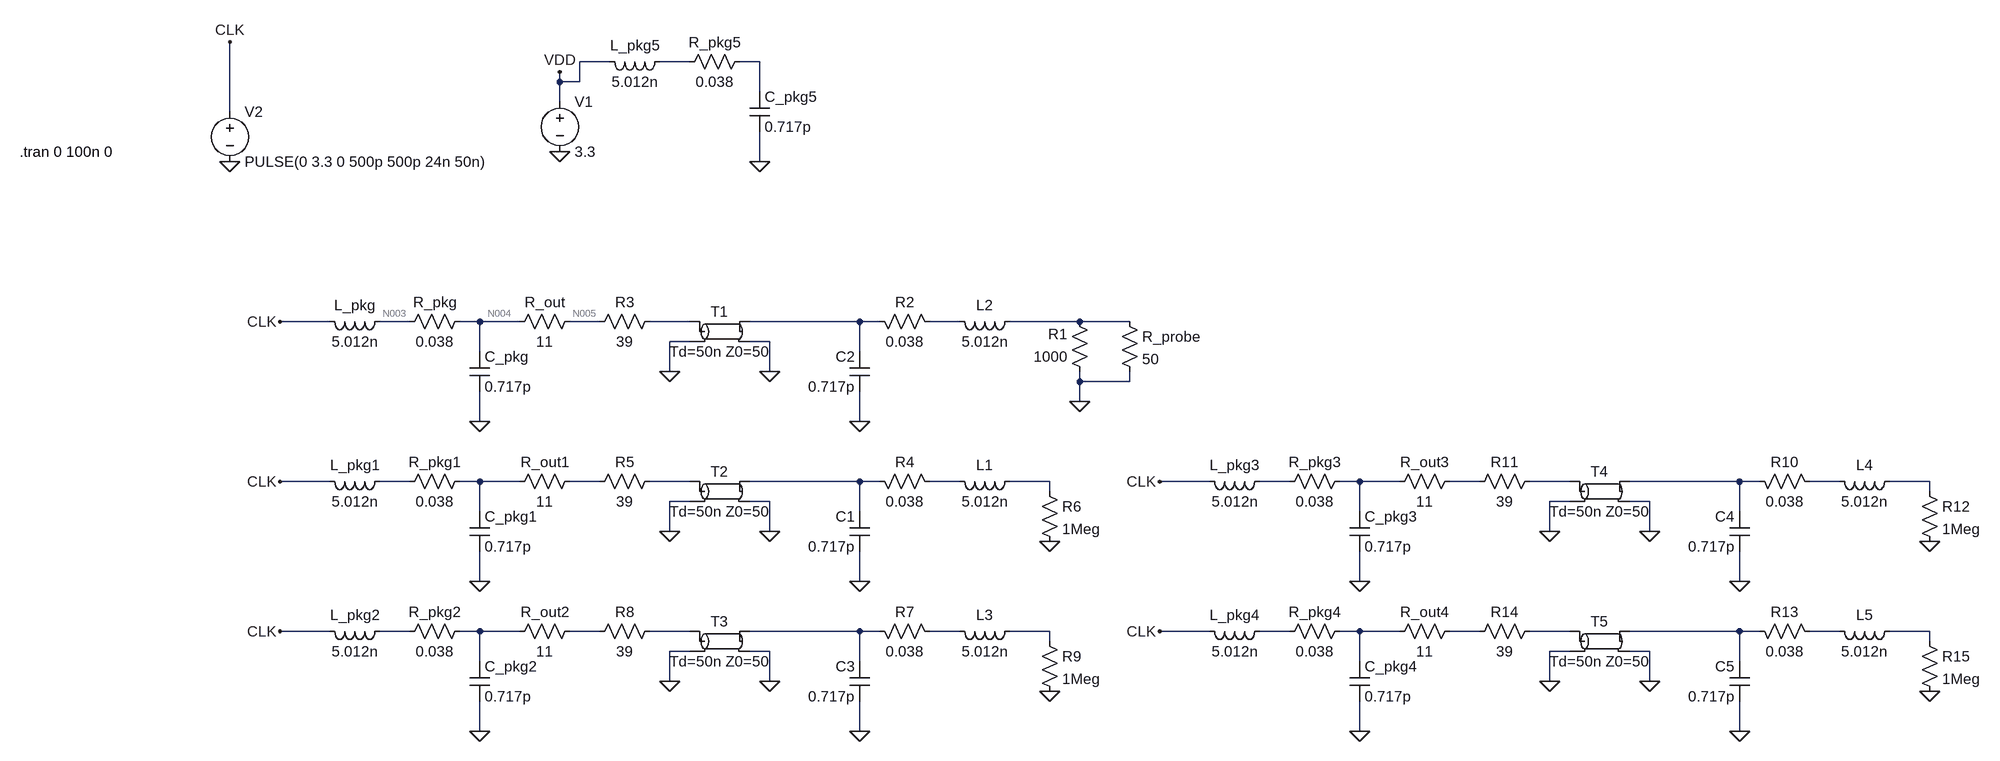
[diagram p0: schematic Assignment2_SOIC.asc]
Assignment2_SOIC.asc, the LTspice schematic file:
Version 4.1
SHEET 1 2280 948
WIRE 80 -144 32 -144
WIRE 208 -144 160 -144
WIRE 320 -144 288 -144
WIRE 0 -112 0 -128
WIRE 32 -112 32 -144
WIRE 32 -112 0 -112
WIRE 320 -96 320 -144
WIRE 0 -80 0 -112
WIRE -528 -64 -528 -176
WIRE 320 16 320 -32
WIRE -368 272 -448 272
WIRE -240 272 -288 272
WIRE -128 272 -160 272
WIRE -64 272 -128 272
WIRE 64 272 16 272
WIRE 208 272 144 272
WIRE 480 272 304 272
WIRE 512 272 480 272
WIRE 640 272 592 272
WIRE 832 272 720 272
WIRE 912 272 832 272
WIRE 208 304 176 304
WIRE 336 304 304 304
WIRE -128 320 -128 272
WIRE 480 320 480 272
WIRE 176 352 176 304
WIRE 336 352 336 304
WIRE 832 368 832 352
WIRE 912 368 912 352
WIRE 912 368 832 368
WIRE 832 400 832 368
WIRE -128 432 -128 384
WIRE 480 432 480 384
WIRE -368 528 -448 528
WIRE -240 528 -288 528
WIRE -128 528 -160 528
WIRE -64 528 -128 528
WIRE 64 528 16 528
WIRE 208 528 144 528
WIRE 480 528 304 528
WIRE 512 528 480 528
WIRE 640 528 592 528
WIRE 784 528 720 528
WIRE 1040 528 960 528
WIRE 1168 528 1120 528
WIRE 1280 528 1248 528
WIRE 1344 528 1280 528
WIRE 1472 528 1424 528
WIRE 1616 528 1552 528
WIRE 1888 528 1712 528
WIRE 1920 528 1888 528
WIRE 2048 528 2000 528
WIRE 2192 528 2128 528
WIRE 784 544 784 528
WIRE 2192 544 2192 528
WIRE 208 560 176 560
WIRE 336 560 304 560
WIRE 1616 560 1584 560
WIRE 1744 560 1712 560
WIRE -128 576 -128 528
WIRE 480 576 480 528
WIRE 1280 576 1280 528
WIRE 1888 576 1888 528
WIRE 176 608 176 560
WIRE 336 608 336 560
WIRE 1584 608 1584 560
WIRE 1744 608 1744 560
WIRE -128 688 -128 640
WIRE 480 688 480 640
WIRE 1280 688 1280 640
WIRE 1888 688 1888 640
WIRE -368 768 -448 768
WIRE -240 768 -288 768
WIRE -128 768 -160 768
WIRE -64 768 -128 768
WIRE 64 768 16 768
WIRE 208 768 144 768
WIRE 480 768 304 768
WIRE 512 768 480 768
WIRE 640 768 592 768
WIRE 784 768 720 768
WIRE 1040 768 960 768
WIRE 1168 768 1120 768
WIRE 1280 768 1248 768
WIRE 1344 768 1280 768
WIRE 1472 768 1424 768
WIRE 1616 768 1552 768
WIRE 1888 768 1712 768
WIRE 1920 768 1888 768
WIRE 2048 768 2000 768
WIRE 2192 768 2128 768
WIRE 784 784 784 768
WIRE 2192 784 2192 768
WIRE 208 800 176 800
WIRE 336 800 304 800
WIRE 1616 800 1584 800
WIRE 1744 800 1712 800
WIRE -128 816 -128 768
WIRE 480 816 480 768
WIRE 1280 816 1280 768
WIRE 1888 816 1888 768
WIRE 176 848 176 800
WIRE 336 848 336 800
WIRE 1584 848 1584 800
WIRE 1744 848 1744 800
WIRE -128 928 -128 880
WIRE 480 928 480 880
WIRE 1280 928 1280 880
WIRE 1888 928 1888 880
FLAG -528 16 0
FLAG 0 0 0
FLAG 0 -128 VDD
FLAG -528 -176 CLK
FLAG -128 432 0
FLAG 480 432 0
FLAG 176 352 0
FLAG 336 352 0
FLAG -448 272 CLK
FLAG 832 400 0
FLAG -128 688 0
FLAG 480 688 0
FLAG 176 608 0
FLAG 336 608 0
FLAG -448 528 CLK
FLAG 784 624 0
FLAG -128 928 0
FLAG 480 928 0
FLAG 176 848 0
FLAG 336 848 0
FLAG -448 768 CLK
FLAG 784 864 0
FLAG 1280 688 0
FLAG 1888 688 0
FLAG 1584 608 0
FLAG 1744 608 0
FLAG 960 528 CLK
FLAG 2192 624 0
FLAG 1280 928 0
FLAG 1888 928 0
FLAG 1584 848 0
FLAG 1744 848 0
FLAG 960 768 CLK
FLAG 2192 864 0
FLAG 320 16 0
SYMBOL voltage 0 -96 R0
WINDOW 123 0 0 Left 0
WINDOW 39 0 0 Left 0
SYMATTR InstName V1
SYMATTR Value 3.3
SYMBOL voltage -528 -80 R0
WINDOW 123 0 0 Left 0
WINDOW 39 0 0 Left 0
SYMATTR InstName V2
SYMATTR Value PULSE(0 3.3 0 500p 500p 24n 50n)
SYMBOL ind -272 256 R90
WINDOW 0 5 56 VBottom 2
WINDOW 3 32 56 VTop 2
SYMATTR InstName L_pkg
SYMATTR Value 5.012n
SYMATTR SpiceLine Rser=1m
SYMBOL res -144 256 R90
WINDOW 0 0 56 VBottom 2
WINDOW 3 32 56 VTop 2
SYMATTR InstName R_pkg
SYMATTR Value 0.038
SYMBOL cap -144 320 R0
SYMATTR InstName C_pkg
SYMATTR Value 0.717p
SYMBOL ind 624 256 M90
WINDOW 0 5 56 VBottom 2
WINDOW 3 32 56 VTop 2
SYMATTR InstName L2
SYMATTR Value 5.012n
SYMATTR SpiceLine Rser=1m
SYMBOL res 496 256 M90
WINDOW 0 0 56 VBottom 2
WINDOW 3 32 56 VTop 2
SYMATTR InstName R2
SYMATTR Value 0.038
SYMBOL cap 496 320 M0
SYMATTR InstName C2
SYMATTR Value 0.717p
SYMBOL res 160 256 R90
WINDOW 0 0 56 VBottom 2
WINDOW 3 32 56 VTop 2
SYMATTR InstName R3
SYMATTR Value 39
SYMBOL res 32 256 R90
WINDOW 0 0 56 VBottom 2
WINDOW 3 32 56 VTop 2
SYMATTR InstName R_out
SYMATTR Value 11
SYMBOL tline 256 288 R0
SYMATTR InstName T1
SYMBOL res 848 368 R180
WINDOW 0 36 76 Left 2
WINDOW 3 36 40 Left 2
SYMATTR InstName R1
SYMATTR Value 1000
SYMBOL res 896 256 R0
SYMATTR InstName R_probe
SYMATTR Value 50
SYMBOL ind -272 512 R90
WINDOW 0 5 56 VBottom 2
WINDOW 3 32 56 VTop 2
SYMATTR InstName L_pkg1
SYMATTR Value 5.012n
SYMATTR SpiceLine Rser=1m
SYMBOL res -144 512 R90
WINDOW 0 0 56 VBottom 2
WINDOW 3 32 56 VTop 2
SYMATTR InstName R_pkg1
SYMATTR Value 0.038
SYMBOL cap -144 576 R0
SYMATTR InstName C_pkg1
SYMATTR Value 0.717p
SYMBOL ind 624 512 M90
WINDOW 0 5 56 VBottom 2
WINDOW 3 32 56 VTop 2
SYMATTR InstName L1
SYMATTR Value 5.012n
SYMATTR SpiceLine Rser=1m
SYMBOL res 496 512 M90
WINDOW 0 0 56 VBottom 2
WINDOW 3 32 56 VTop 2
SYMATTR InstName R4
SYMATTR Value 0.038
SYMBOL cap 496 576 M0
SYMATTR InstName C1
SYMATTR Value 0.717p
SYMBOL res 160 512 R90
WINDOW 0 0 56 VBottom 2
WINDOW 3 32 56 VTop 2
SYMATTR InstName R5
SYMATTR Value 39
SYMBOL res 32 512 R90
WINDOW 0 0 56 VBottom 2
WINDOW 3 32 56 VTop 2
SYMATTR InstName R_out1
SYMATTR Value 11
SYMBOL tline 256 544 R0
SYMATTR InstName T2
SYMBOL res 768 528 R0
SYMATTR InstName R6
SYMATTR Value 1Meg
SYMBOL ind -272 752 R90
WINDOW 0 5 56 VBottom 2
WINDOW 3 32 56 VTop 2
SYMATTR InstName L_pkg2
SYMATTR Value 5.012n
SYMATTR SpiceLine Rser=1m
SYMBOL res -144 752 R90
WINDOW 0 0 56 VBottom 2
WINDOW 3 32 56 VTop 2
SYMATTR InstName R_pkg2
SYMATTR Value 0.038
SYMBOL cap -144 816 R0
SYMATTR InstName C_pkg2
SYMATTR Value 0.717p
SYMBOL ind 624 752 M90
WINDOW 0 5 56 VBottom 2
WINDOW 3 32 56 VTop 2
SYMATTR InstName L3
SYMATTR Value 5.012n
SYMATTR SpiceLine Rser=1m
SYMBOL res 496 752 M90
WINDOW 0 0 56 VBottom 2
WINDOW 3 32 56 VTop 2
SYMATTR InstName R7
SYMATTR Value 0.038
SYMBOL cap 496 816 M0
SYMATTR InstName C3
SYMATTR Value 0.717p
SYMBOL res 160 752 R90
WINDOW 0 0 56 VBottom 2
WINDOW 3 32 56 VTop 2
SYMATTR InstName R8
SYMATTR Value 39
SYMBOL res 32 752 R90
WINDOW 0 0 56 VBottom 2
WINDOW 3 32 56 VTop 2
SYMATTR InstName R_out2
SYMATTR Value 11
SYMBOL tline 256 784 R0
SYMATTR InstName T3
SYMBOL res 768 768 R0
SYMATTR InstName R9
SYMATTR Value 1Meg
SYMBOL ind 1136 512 R90
WINDOW 0 5 56 VBottom 2
WINDOW 3 32 56 VTop 2
SYMATTR InstName L_pkg3
SYMATTR Value 5.012n
SYMATTR SpiceLine Rser=1m
SYMBOL res 1264 512 R90
WINDOW 0 0 56 VBottom 2
WINDOW 3 32 56 VTop 2
SYMATTR InstName R_pkg3
SYMATTR Value 0.038
SYMBOL cap 1264 576 R0
SYMATTR InstName C_pkg3
SYMATTR Value 0.717p
SYMBOL ind 2032 512 M90
WINDOW 0 5 56 VBottom 2
WINDOW 3 32 56 VTop 2
SYMATTR InstName L4
SYMATTR Value 5.012n
SYMATTR SpiceLine Rser=1m
SYMBOL res 1904 512 M90
WINDOW 0 0 56 VBottom 2
WINDOW 3 32 56 VTop 2
SYMATTR InstName R10
SYMATTR Value 0.038
SYMBOL cap 1904 576 M0
SYMATTR InstName C4
SYMATTR Value 0.717p
SYMBOL res 1568 512 R90
WINDOW 0 0 56 VBottom 2
WINDOW 3 32 56 VTop 2
SYMATTR InstName R11
SYMATTR Value 39
SYMBOL res 1440 512 R90
WINDOW 0 0 56 VBottom 2
WINDOW 3 32 56 VTop 2
SYMATTR InstName R_out3
SYMATTR Value 11
SYMBOL tline 1664 544 R0
SYMATTR InstName T4
SYMBOL res 2176 528 R0
SYMATTR InstName R12
SYMATTR Value 1Meg
SYMBOL ind 1136 752 R90
WINDOW 0 5 56 VBottom 2
WINDOW 3 32 56 VTop 2
SYMATTR InstName L_pkg4
SYMATTR Value 5.012n
SYMATTR SpiceLine Rser=1m
SYMBOL res 1264 752 R90
WINDOW 0 0 56 VBottom 2
WINDOW 3 32 56 VTop 2
SYMATTR InstName R_pkg4
SYMATTR Value 0.038
SYMBOL cap 1264 816 R0
SYMATTR InstName C_pkg4
SYMATTR Value 0.717p
SYMBOL ind 2032 752 M90
WINDOW 0 5 56 VBottom 2
WINDOW 3 32 56 VTop 2
SYMATTR InstName L5
SYMATTR Value 5.012n
SYMATTR SpiceLine Rser=1m
SYMBOL res 1904 752 M90
WINDOW 0 0 56 VBottom 2
WINDOW 3 32 56 VTop 2
SYMATTR InstName R13
SYMATTR Value 0.038
SYMBOL cap 1904 816 M0
SYMATTR InstName C5
SYMATTR Value 0.717p
SYMBOL res 1568 752 R90
WINDOW 0 0 56 VBottom 2
WINDOW 3 32 56 VTop 2
SYMATTR InstName R14
SYMATTR Value 39
SYMBOL res 1440 752 R90
WINDOW 0 0 56 VBottom 2
WINDOW 3 32 56 VTop 2
SYMATTR InstName R_out4
SYMATTR Value 11
SYMBOL tline 1664 784 R0
SYMATTR InstName T5
SYMBOL res 2176 768 R0
SYMATTR InstName R15
SYMATTR Value 1Meg
SYMBOL ind 176 -160 R90
WINDOW 0 5 56 VBottom 2
WINDOW 3 32 56 VTop 2
SYMATTR InstName L_pkg5
SYMATTR Value 5.012n
SYMATTR SpiceLine Rser=1m
SYMBOL res 304 -160 R90
WINDOW 0 0 56 VBottom 2
WINDOW 3 32 56 VTop 2
SYMATTR InstName R_pkg5
SYMATTR Value 0.038
SYMBOL cap 304 -96 R0
SYMATTR InstName C_pkg5
SYMATTR Value 0.717p
TEXT -864 0 Left 2 !.tran 0 100n 0

The netlist it stands for:
* Assignment2_SOIC.asc
V1 VDD 0 3.3
V2 CLK 0 PULSE(0 3.3 0 500p 500p 24n 50n)
L_pkg N003 CLK 5.012n Rser=1m
R_pkg N004 N003 0.038
C_pkg N004 0 0.717p
L2 N008 N009 5.012n Rser=1m
R2 N007 N008 0.038
C2 N007 0 0.717p
R3 N006 N005 39
R_out N005 N004 11
T1 N006 0 N007 0 Td=50n Z0=50
R1 0 N009 1000
R_probe N009 0 50
L_pkg1 N010 CLK 5.012n Rser=1m
R_pkg1 N011 N010 0.038
C_pkg1 N011 0 0.717p
L1 N015 N016 5.012n Rser=1m
R4 N014 N015 0.038
C1 N014 0 0.717p
R5 N013 N012 39
R_out1 N012 N011 11
T2 N013 0 N014 0 Td=50n Z0=50
R6 N016 0 1Meg
L_pkg2 N024 CLK 5.012n Rser=1m
R_pkg2 N025 N024 0.038
C_pkg2 N025 0 0.717p
L3 N029 N030 5.012n Rser=1m
R7 N028 N029 0.038
C3 N028 0 0.717p
R8 N027 N026 39
R_out2 N026 N025 11
T3 N027 0 N028 0 Td=50n Z0=50
R9 N030 0 1Meg
L_pkg3 N017 CLK 5.012n Rser=1m
R_pkg3 N018 N017 0.038
C_pkg3 N018 0 0.717p
L4 N022 N023 5.012n Rser=1m
R10 N021 N022 0.038
C4 N021 0 0.717p
R11 N020 N019 39
R_out3 N019 N018 11
T4 N020 0 N021 0 Td=50n Z0=50
R12 N023 0 1Meg
L_pkg4 N031 CLK 5.012n Rser=1m
R_pkg4 N032 N031 0.038
C_pkg4 N032 0 0.717p
L5 N036 N037 5.012n Rser=1m
R13 N035 N036 0.038
C5 N035 0 0.717p
R14 N034 N033 39
R_out4 N033 N032 11
T5 N034 0 N035 0 Td=50n Z0=50
R15 N037 0 1Meg
L_pkg5 N001 VDD 5.012n Rser=1m
R_pkg5 N002 N001 0.038
C_pkg5 N002 0 0.717p
.tran 0 100n 0
.backanno
.end

* Results of the author's LTspice run, read from the files saved beside the schematic
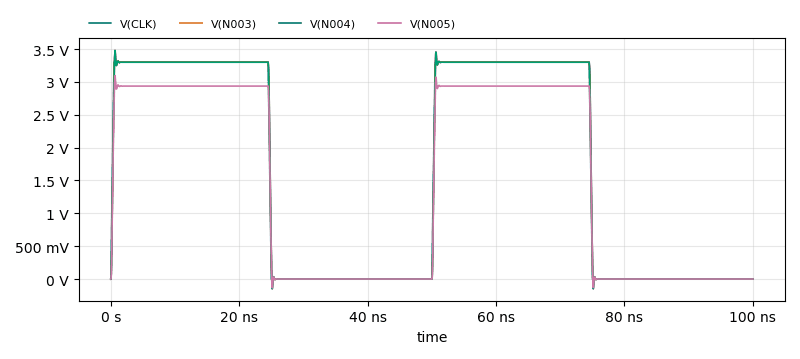
[diagram p1: Transient Analysis of Assignment2_SOIC.asc, plotted from the saved traces]
* Transient Analysis, 1 run:
*   V(CLK): min 0 V, max 3.3 V, average 1.617 V, rms 2.302 V, last 0 V
*   V(N003): min -148.8 mV, max 3.479 V, average 1.617 V, rms 2.303 V, last 0 V
*   V(N004): min -148.7 mV, max 3.478 V, average 1.616 V, rms 2.302 V, last 0 V
*   V(N005): min -132.4 mV, max 3.096 V, average 1.439 V, rms 2.049 V, last 0 V